# Altium schematic sheet Connector_Section.SchDoc
size A4
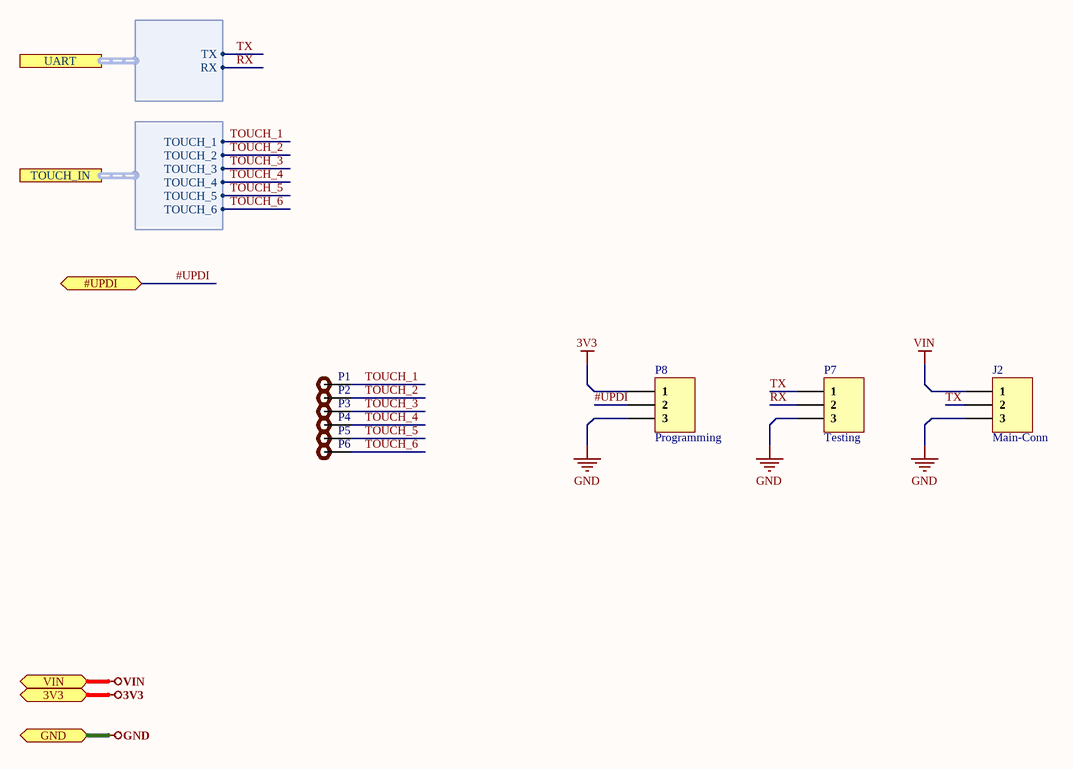
[diagram p0: Connector_Section.SchDoc]

## Parts
J2  Main-Conn  [S3B-XH-A-1(LF)(SN)]
P1  Test Point  [TEST POINT]  (value not drawn)
P2  Test Point  [TEST POINT]  (value not drawn)
P3  Test Point  [TEST POINT]  (value not drawn)
P4  Test Point  [TEST POINT]  (value not drawn)
P5  Test Point  [TEST POINT]  (value not drawn)
P6  Test Point  [TEST POINT]  (value not drawn)
P7  Testing  [HDR1X3]
P8  Programming  [HDR1X3]

## Ports
3V3 (bidir), #UPDI (bidir), GND (bidir), TOUCH_IN (harness Touch_Harness), UART (harness UART_Harness), VIN (bidir)

## Harnesses
UART_Harness: TX, RX
Touch_Harness: TOUCH_1, TOUCH_2, TOUCH_3, TOUCH_4, TOUCH_5, TOUCH_6

## Nets
3V3: P8.1 ; port 3V3
GND: J2.3 P7.3 P8.3 ; port GND
VIN: J2.1 ; port VIN
#UPDI: P8.2 ; port #UPDI
RX: P7.2 ; port UART.RX
TOUCH_1: P1.1 ; port TOUCH_IN.TOUCH_1
TOUCH_2: P2.1 ; port TOUCH_IN.TOUCH_2
TOUCH_3: P3.1 ; port TOUCH_IN.TOUCH_3
TOUCH_4: P4.1 ; port TOUCH_IN.TOUCH_4
TOUCH_5: P5.1 ; port TOUCH_IN.TOUCH_5
TOUCH_6: P6.1 ; port TOUCH_IN.TOUCH_6
TX: J2.2 P7.1 ; port UART.TX

## Library data of the parts
J2 = S3B-XH-A-1(LF)(SN): CONN HEADER XH SIDE 3POS 2.5MM; Manufacturer: JST; Connector Type: Male Pin; Number of Positions: 3; Pitch: 0.098inch; Supplier 1: Digi-Key; Manufacturer Part Number: S3B-XH-A-1(LF)(SN); RoHS: Yes; Category: Connectors; Pricing 1: 1=0.22000, 10=0.20900, 100=0.14520, 500=0.12282, 1000=0.10049, 5000=0.08933, 10000=0.08095 (USD); Mount: Through Hole; Color: Natural; Contact Plating: Tin; Termination: Press-Fit; Package Quantity: 1000; Number of Rows: 1; Packaging: Bulk; Fastening Type: Detent; Lead Free: Lead Free; ComponentLink1URL: https://datasheet.ciiva.com/725/exh-725857.pdf?src-supplier=Digi-Key; ComponentLink1Description: https://datasheet.ciiva.com/725/exh-725857.pdf?src-supplier=Digi-Key; ComponentLink2URL: https://datasheet.ciiva.com/16484/ejq-16484618.pdf?src-supplier=Future+Electronics; ComponentLink2Description: https://datasheet.ciiva.com/16484/ejq-16484618.pdf?src-supplier=Future+Electronics; Supplier Part Number 1: 455-2954-ND
P1-P6 = TEST POINT: Test Point ON
P7 P8 = Header 3: CONN HEADER VERT 3POS 2.54MM; Manufacturer: Wurth Electronics; Manufacturer Part Number: 61300311121; Number of Positions: 3; Gender: Male; Connector Type: Male Pin; Pitch: 0.1inch; Supplier 1: Digi-Key; Stock 1: 81286; Pricing 1: 1=0.13, 10=0.106, 25=0.088, 50=0.074, 100=0.067, 1000=0.061 (USD); Mount: Through Hole; Contact Plating: Gold; Contact Material: Copper; Color: Black; Number of Rows: 1; Packaging: Bulk; Termination: Solder; Number of Contacts: 3; Contact Mating Length: 0.236inch; REACH SVHC: Unknown; Lead Free: Lead Free; ComponentLink1URL: http://www.farnell.com/cad/1737268.pdf?src-supplier=Element14; ComponentLink1Description: http://www.farnell.com/cad/1737268.pdf?src-supplier=Element14; ComponentLink2URL: https://katalog.we-online.de/em/datasheet/6130xx11121.pdf?src-supplier=Digi-Key; ComponentLink2Description: https://katalog.we-online.de/em/datasheet/6130xx11121.pdf?src-supplier=Digi-Key; Supplier Part Number 1: 732-5316-ND